# Altium schematic sheet CIU9872B_01(1.1)_EXT_01D2电路参考设计A0.SchDoc: 01D2 7816接口电路参考设计
size A4; Date: 2025/11/20; Author: zhangkzh; CompanyName: 北京中电华大电子设计有限责任公司; Revision: A0; SheetNumber: 1; SheetTotal: 3; Project: CIU9872B_01(1.1)_EXT  DFN8_3x3; Reference: None
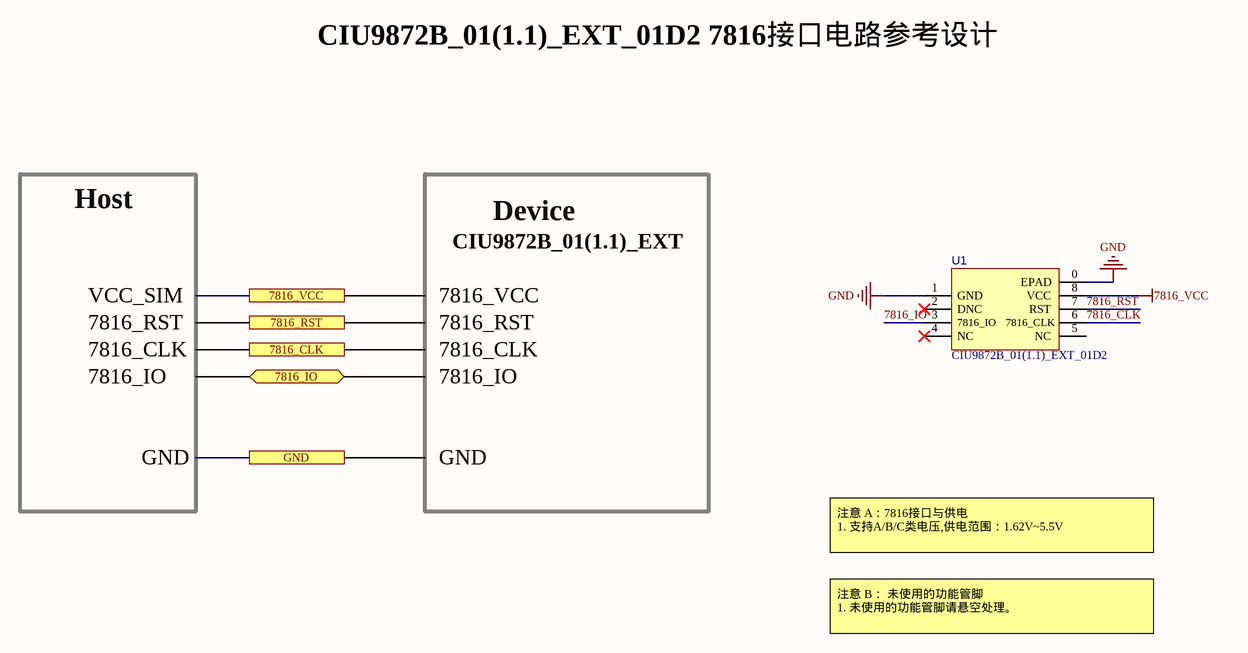
[diagram p0: CIU9872B_01(1.1)_EXT_01D2电路参考设计A0.SchDoc]

## Parts
U1  CIU9872B_01(1.1)_EXT_01D2  [DFN8_5x6_DJK]

## Sub-sheets
Device = ?: no entries
Host = ?: no entries

## Ports
7816_CLK (in), 7816_IO (bidir), 7816_RST (in), 7816_VCC, GND

## Nets
7816_VCC: U1.8(VCC)
GND: U1.0(EPAD) U1.1(GND)
7816_CLK: U1.6(7816_CLK)
7816_IO: U1.3(7816_IO)
7816_RST: U1.7(RST)

Not connected (* = marked no-connect by the designer): U1 2(DNC)* 4(NC)* 5(NC)

## Notes on the sheet
- CIU9872B_01(1.1)_EXT_01D2 7816接口电路参考设计
- CIU9872B_01(1.1)_EXT
- 7816_RST
- VCC_SIM
- 7816_VCC
- 7816_CLK
- 7816_IO
- GND
- 注意 A：7816接口与供电
  1. 支持A/B/C类电压,供电范围：1.62V~5.5V
- 注意 B： 未使用的功能管脚
  1. 未使用的功能管脚请悬空处理。
- Title:
- Project:
- Size:
- A4
- Reference:
- Revision:
- Author:
- Date:
- Sheet:
- of

## Library data of the parts
U1 = IC_G25_D1_DFN8_3x3: DFN8_3x3_7816+SWP